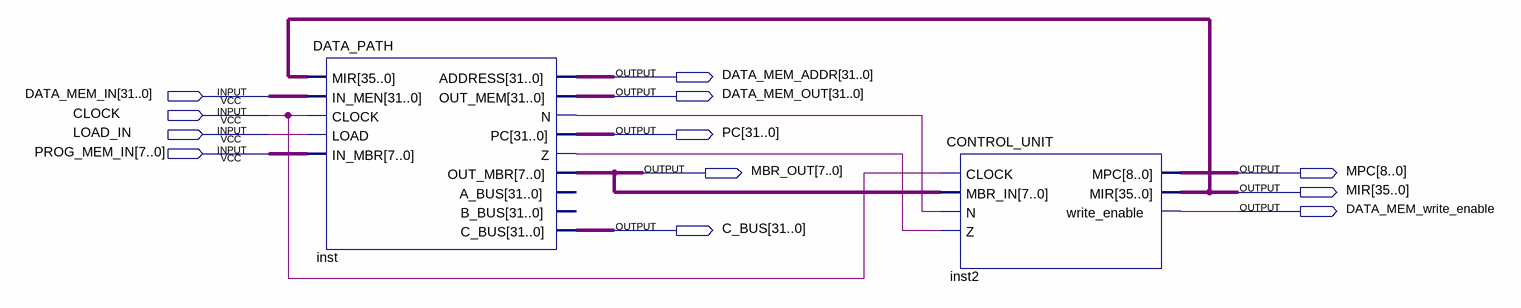
[diagram p0: schematic sheet]
// Quartus schematic CPU.bdf as structural Verilog: 2 symbols, 12 pins
module CPU (
  input  [31:0] DATA_MEM_IN,
  input  CLOCK,
  input  LOAD_IN,
  input  [7:0] PROG_MEM_IN,
  output [31:0] DATA_MEM_ADDR,
  output [31:0] DATA_MEM_OUT,
  output [31:0] PC,
  output [7:0] MBR_OUT,
  output [8:0] MPC,
  output [35:0] MIR,
  output DATA_MEM_write_enable,
  output [31:0] C_BUS
);

  wire inst_n, inst_z;

  DATA_PATH inst (
    .MIR(MIR), .IN_MEN(DATA_MEM_IN), .CLOCK(CLOCK), .LOAD(LOAD_IN), .IN_MBR(PROG_MEM_IN),
    .ADDRESS(DATA_MEM_ADDR), .OUT_MEM(DATA_MEM_OUT), .N(inst_n), .PC(PC), .Z(inst_z), .OUT_MBR(MBR_OUT),
    .C_BUS(C_BUS));  // open: A_BUS, B_BUS
  CONTROL_UNIT inst2 (
    .CLOCK(CLOCK), .MBR_IN(MBR_OUT), .N(inst_n), .Z(inst_z), .MPC(MPC), .MIR(MIR),
    .write_enable(DATA_MEM_write_enable));
endmodule
